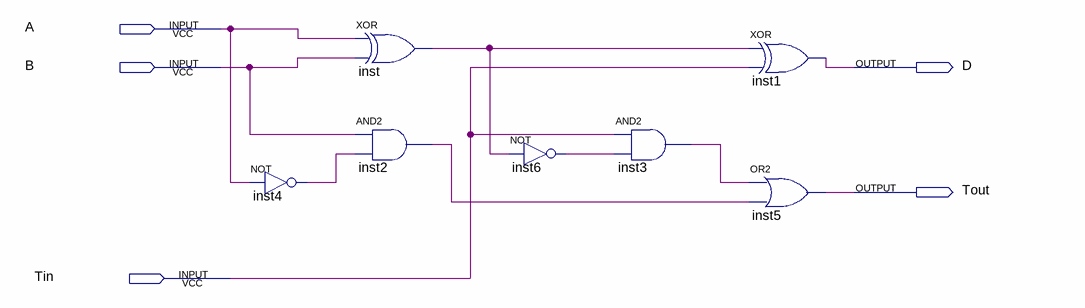
[diagram p0: schematic sheet]
// Quartus schematic SubtratorCompleto.bdf as structural Verilog: 7 symbols, 5 pins
module SubtratorCompleto (
  input  A,
  input  B,
  input  Tin,
  output D,
  output Tout
);

  wire inst2_out, inst3_out, inst4_out, inst6_out, inst_out;

  not inst4 (inst4_out, A);
  xor inst (inst_out, A, B);
  and inst2 (inst2_out, B, inst4_out);
  not inst6 (inst6_out, inst_out);
  and inst3 (inst3_out, Tin, inst6_out);
  xor inst1 (D, inst_out, Tin);
  or inst5 (Tout, inst3_out, inst2_out);
endmodule
